# Altium schematic sheet CurrentSamping.SchDoc
size A4; SheetNumber: 3; SheetTotal: 6
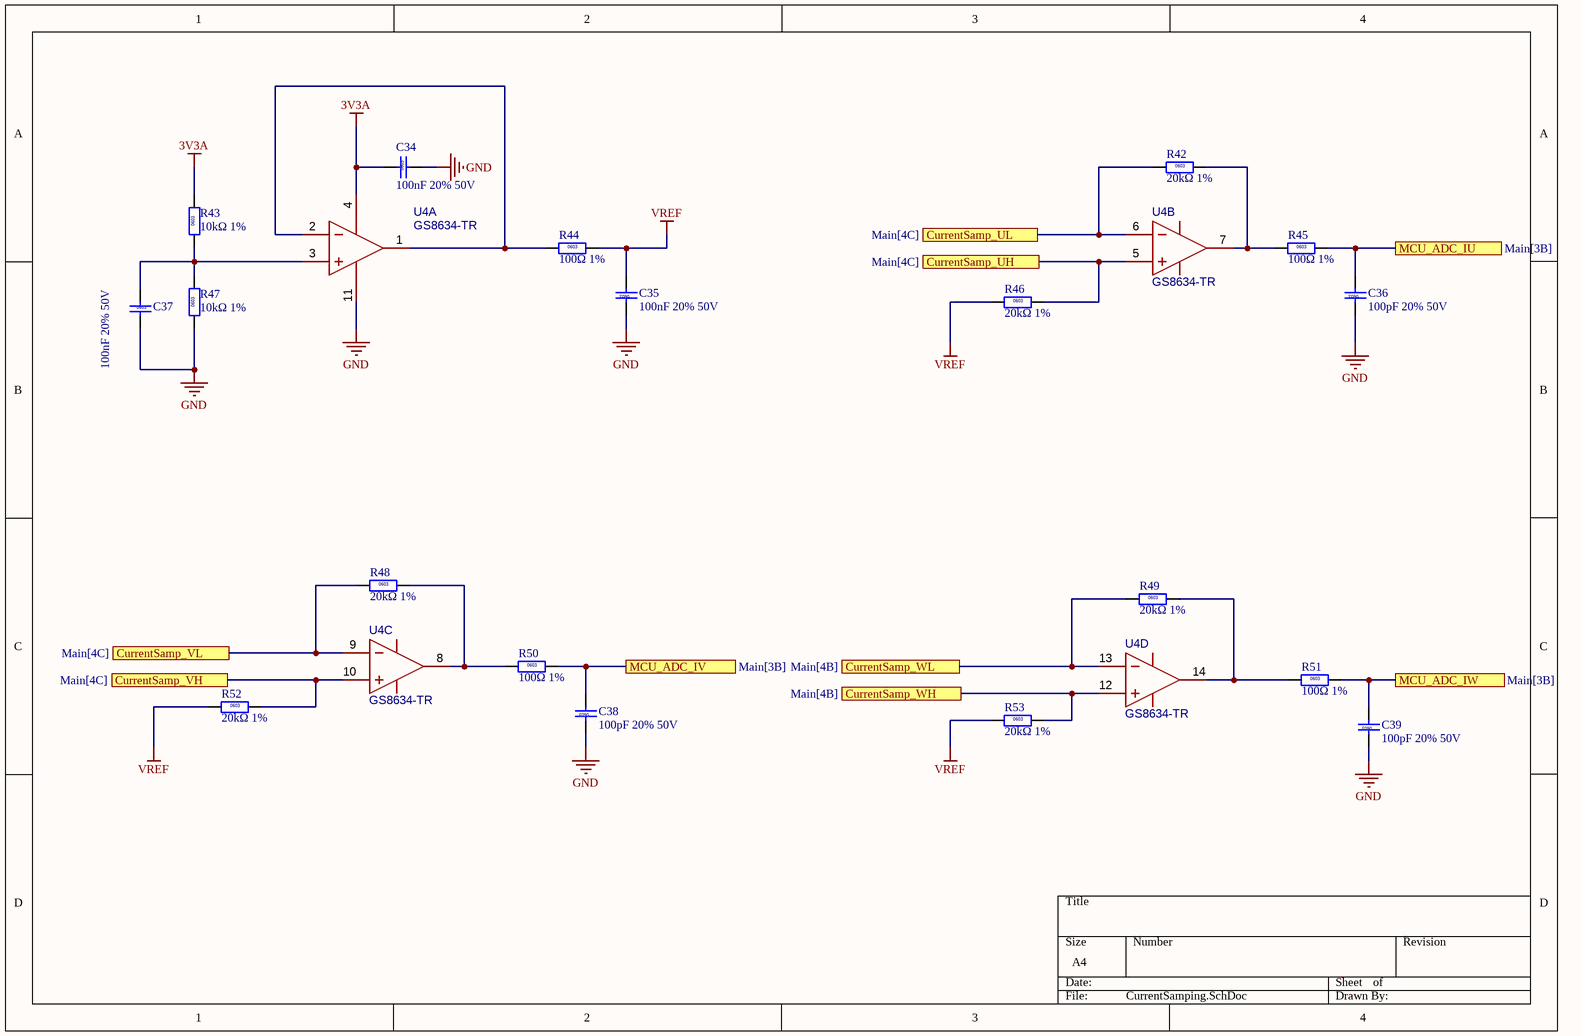
[diagram p0: CurrentSamping.SchDoc]

## Parts
C34  100nF 20% 50V  [C0603]
C35  100nF 20% 50V  [C0603]
C36  100pF 20% 50V  [C0603]
C37  100nF 20% 50V  [C0603]
C38  100pF 20% 50V  [C0603]
C39  100pF 20% 50V  [C0603]
R42  20kΩ 1%  [R0603]
R43  10kΩ 1%  [R0603]
R44  100Ω 1%  [R0603]
R45  100Ω 1%  [R0603]
R46  20kΩ 1%  [R0603]
R47  10kΩ 1%  [R0603]
R48  20kΩ 1%  [R0603]
R49  20kΩ 1%  [R0603]
R50  100Ω 1%  [R0603]
R51  100Ω 1%  [R0603]
R52  20kΩ 1%  [R0603]
R53  20kΩ 1%  [R0603]
U4  GS8634-TR  [SOP-14_L5.0-W4.4-P0.65-LS6.4-BL]  (parts A,B,C,D of 4)

## Ports
CurrentSamp_UH (see Main[4C]), CurrentSamp_UL (see Main[4C]), CurrentSamp_VH (see Main[4C]), CurrentSamp_VL (see Main[4C]), CurrentSamp_WH (see Main[4B]), CurrentSamp_WL (see Main[4B]), MCU_ADC_IU (see Main[3B]), MCU_ADC_IV (see Main[3B]), MCU_ADC_IW (see Main[3B])

## Nets
3V3A: C34.1 R43.2 U4.4(VDD)
GND: C34.2 C35.1 C36.1 C37.2 C38.1 C39.1 R47.1 U4.11(VSS)
VREF: C35.2 R44.2 R46.1 R52.1 R53.1
CurrentSamp_UH: R46.2 U4.5(INB+) ; port CurrentSamp_UH
CurrentSamp_UL: R42.1 U4.6(INB-) ; port CurrentSamp_UL
CurrentSamp_VH: R52.2 U4.10(INC+) ; port CurrentSamp_VH
CurrentSamp_VL: R48.1 U4.9(INC-) ; port CurrentSamp_VL
CurrentSamp_WH: R53.2 U4.12(IND+) ; port CurrentSamp_WH
CurrentSamp_WL: R49.1 U4.13(IND-) ; port CurrentSamp_WL
MCU_ADC_IU: C36.2 R45.2 ; port MCU_ADC_IU
MCU_ADC_IV: C38.2 R50.2 ; port MCU_ADC_IV
MCU_ADC_IW: C39.2 R51.2 ; port MCU_ADC_IW
NetC37_1: C37.1 R43.1 R47.2 U4.3(INA+)
NetR42_2: R42.2 R45.1 U4.7(OUTB)
NetR44_1: R44.1 U4.1(OUTA) U4.2(INA-)
NetR48_2: R48.2 R50.1 U4.8(OUTC)
NetR49_2: R49.2 R51.1 U4.14(OUTD)

## Notes on the sheet
- (in symbol C0603) 0603
- (in symbol R0603) 0603

## Library data of the parts
C34-C39 = C0603: 贴片电容; Package: C0603
R42-R53 = R0603: 贴片电阻; Package: R0603
U4 = GS8634-TR: 放大器数:4;轨到轨:轨到轨输入,轨到轨输出;增益带宽积(GBW):6MHz;输入失调电压(Vos):3.5mV;压摆率(SR):4.2V/us;输入偏置电流(Ib):1pA;; Manufacturer: Gainsil(聚洵); Relevance: []; AddInBom: yes; ModelId: 20b40d9ace5d4e70abc2a10921399e11聨0819f05c4eef4c71ace90d822a990e87; ModelName: SOP-14_L5.0-W4.4-H1.0-LS6.4-P0.65; ModelTransform: 236.714,196.85,0,90,0,0,0,0,0; Number of Channels: 4; Gain Bandwidth Product: 6MHz; Vos - Input Offset Voltage: 3.5mV; Input Offset Voltage Drift(Vos TC): 2.4uV/℃; Ib - Input Bias Current: 1pA; Input Voltage Noise Density: 13nV/√Hz@1kHz; Common Mode Rejection Ratio(CMRR): 90dB; Quiescent Current: 470uA; Output Current: 4mA; Single supply: 2.1V~5.5V; Dual Supply: 1.05V~2.75V；-2.75V~-1.05V; Symbol: GS8634-TR; Device: GS8634-TR; LCSC Part Name: 6MHz 轨到轨 I/O 输出，CMOS 运算放大器; SupplierPart: C157706; ManufacturerPart: GS8634-TR; Supplier Footprint: TSSOP-14; JLCPCB Part Class: Extended Part; Datasheet: https://item.szlcsc.com/datasheet/GS8634-TR/169054.html; Supplier: LCSC; ConvertToPcb: yes; FootprintName: SOP-14_L5.0-W4.4-P0.65-LS6.4-BL; Rail to Rail: 轨到轨输入,轨到轨输出; Slew Rate: 4.2V/us; Input Offset Current(Ios): 1pA; Operating Temperature: -40℃~+125℃; Features: 使能/关断功能